# Altium schematic sheet 06_RFID_RTC_Storage.SchDoc: RFID_RTC_Storage
size A4; SheetNumber: 7; SheetTotal: 12
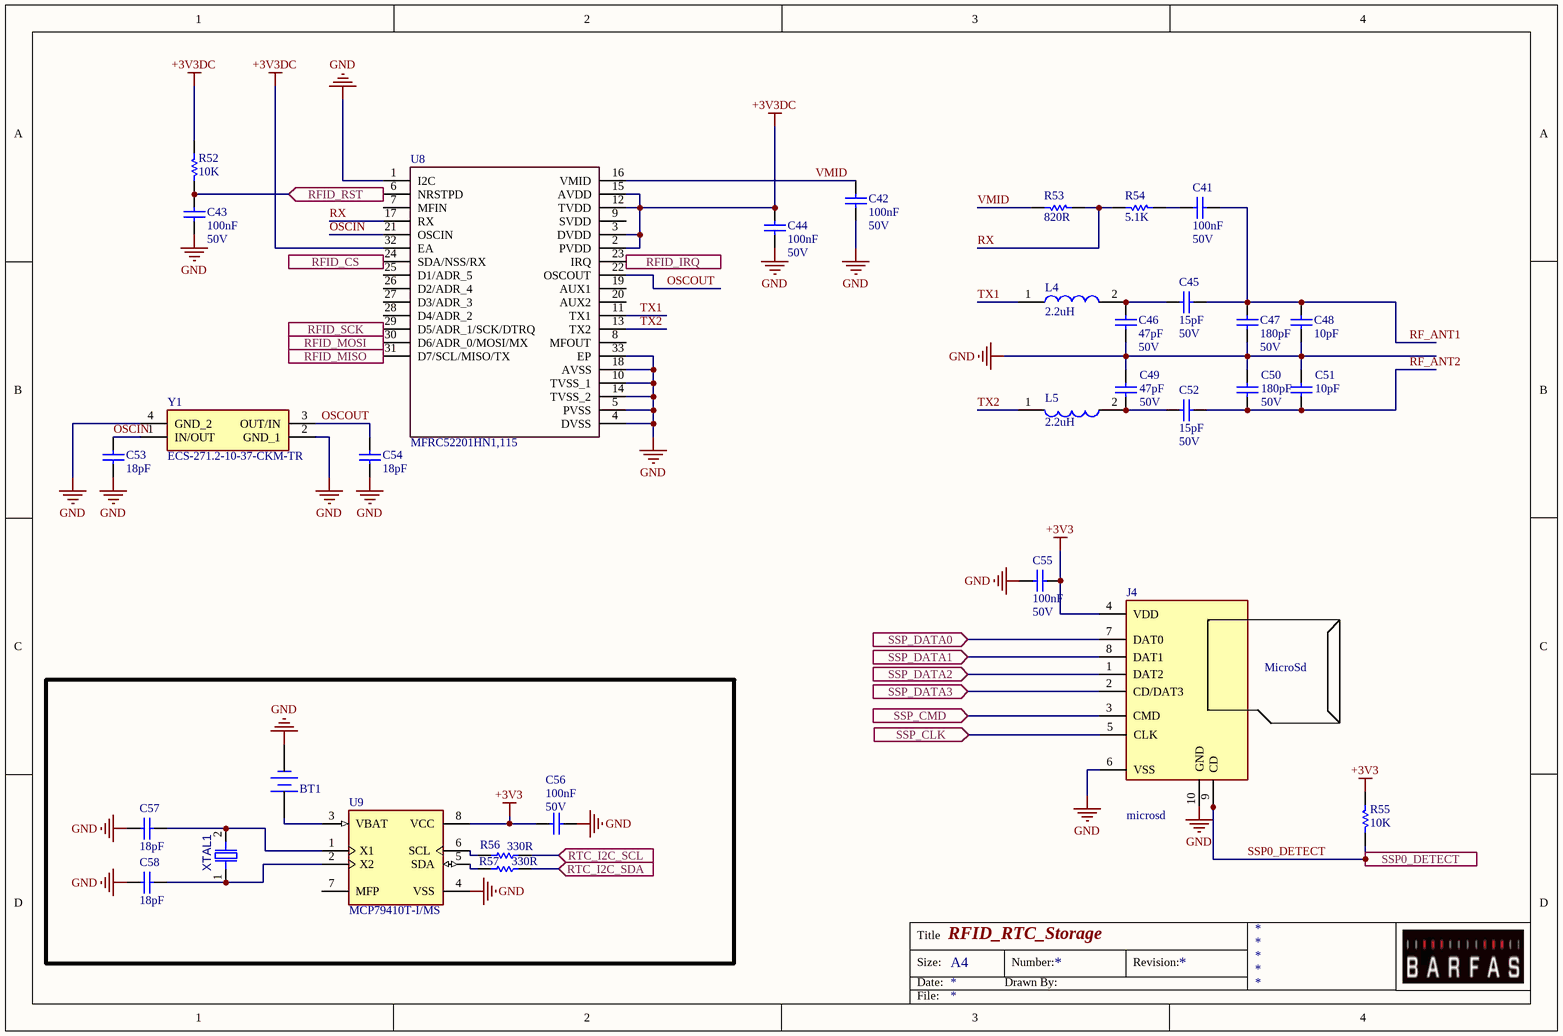
[diagram p0: 06_RFID_RTC_Storage.SchDoc]

## Parts
BT1  DS1092-04-B6P  [DB1092]  (value not drawn)
C41  value 100nF  Voltage: 50V  [CAP_0603]  (hidden comment: CAP)
C42  value 100nF  Voltage: 50V  [CAP_0603]  (hidden comment: CAP)
C43  value 100nF  Voltage: 50V  [CAP_0603]  (hidden comment: CAP)
C44  value 100nF  Voltage: 50V  [CAP_0603]  (hidden comment: CAP)
C45  value 15pF  Voltage: 50V  [CAP_0603]  (hidden comment: CL10C150JB8NNNC)
C46  value 47pF  Voltage: 50V  [CAP_0603]  (hidden comment: CL10C470JB8NNNC)
C47  value 180pF  Voltage: 50V  [CAP_0603]  (hidden comment: CL10C181JB8NNNC)
C48  value 10pF  [CAP_0603]  (hidden comment: CL10C100CB8NNNC)
C49  value 47pF  Voltage: 50V  [CAP_0603]  (hidden comment: CL10C470JB8NNNC)
C50  value 180pF  Voltage: 50V  [CAP_0603]  (hidden comment: CL10C181JB8NNNC)
C51  value 10pF  [CAP_0603]  (hidden comment: CL10C100CB8NNNC)
C52  value 15pF  Voltage: 50V  [CAP_0603]  (hidden comment: CL10C150JB8NNNC)
C53  value 18pF  [CAP_0603]  (hidden comment: CL10C180JB8NNNC)
C54  value 18pF  [CAP_0603]  (hidden comment: CL10C180JB8NNNC)
C55  value 100nF  Voltage: 50V  [CAP_0603]  (hidden comment: CAP)
C56  value 100nF  Voltage: 50V  [CAP_0603]  (hidden comment: CAP)
C57  value 18pF  [CAP_0603]  (hidden comment: CL10C180JB8NNNC)
C58  value 18pF  [CAP_0603]  (hidden comment: CL10C180JB8NNNC)
J4  microsd  [microSD_2]
L4  value 2.2uH  [LQM18PN1R0NC0L]  (hidden comment: LQM18PN2R2NC0L)
L5  value 2.2uH  [LQM18PN1R0NC0L]  (hidden comment: LQM18PN2R2NC0L)
R52  value 10K  [RES_0603]  (hidden comment: RES)
R53  value 820R  [RES_0603]  (hidden comment: 0603SAJ0821T5E)
R54  value 5.1K  [RES_0603]  (hidden comment: RC0603FR-075K1L)
R55  value 10K  [RES_0603]  (hidden comment: RES)
R56  value 330R  [RES_0603]  (hidden comment: 0603SAF3300T5E)
R57  value 330R  [RES_0603]  (hidden comment: 0603SAF3300T5E)
U8  MFRC52201HN1,115  [QFN50P500X500X100-33N-D]
U9  MCP79410T-I/MS  [8_MSOP]
XTAL1  R38-32.768-12.5-EXT-5PPM  [R38_THT_2]  (value not drawn)
Y1  ECS-271.2-10-37-CKM-TR  [ECS27121037CKMTR]

## Ports
RFID_CS (in), RFID_IRQ (in), RFID_MISO (in), RFID_MOSI (in), RFID_RST (in), RFID_SCK (in), RTC_I2C_SCL (in), RTC_I2C_SDA (in), SSP0_DETECT (in), SSP_CLK (in), SSP_CMD (in), SSP_DATA0 (in), SSP_DATA1 (in), SSP_DATA2 (in), SSP_DATA3 (in)

## Nets
+3V3: C55.1 C56.2 J4.4(VDD) R55.1 U9.8(VCC)
+3V3DC: C44.2 R52.1 U8.2(PVDD) U8.3(DVDD) U8.12(TVDD) U8.15(AVDD) U8.32(EA)
GND: BT1.1 C42.1 C43.1 C44.1 C46.2 C47.2 C48.1 C49.1 C50.1 C51.2 C53.1 C54.1 C55.2 C56.1 C57.1 C58.1 J4.6(VSS) J4.10(GND) U8.1(I2C) U8.4(DVSS) U8.5(PVSS) U8.10(TVSS_1) U8.14(TVSS_2) U8.18(AVSS) U8.33(EP) U9.4(VSS) Y1.2(GND_1) Y1.4(GND_2)
OSCIN: C53.2 U8.21(OSCIN) Y1.1(IN/OUT)
OSCOUT: C54.2 U8.22(OSCOUT) Y1.3(OUT/IN)
RF_ANT1: C41.1 C45.1 C47.1 C48.2
RF_ANT2: C50.2 C51.1 C52.1
RFID_CS: U8.24(SDA/NSS/RX) ; port RFID_CS
RFID_IRQ: U8.23(IRQ) ; port RFID_IRQ
RFID_MISO: U8.31(D7/SCL/MISO/TX) ; port RFID_MISO
RFID_MOSI: U8.30(D6/ADR_0/MOSI/MX) ; port RFID_MOSI
RFID_RST: C43.2 R52.2 U8.6(NRSTPD) ; port RFID_RST
RFID_SCK: U8.29(D5/ADR_1/SCK/DTRQ) ; port RFID_SCK
RTC_I2C_SCL: R56.2 ; port RTC_I2C_SCL
RTC_I2C_SDA: R57.2 ; port RTC_I2C_SDA
RX: R53.2 R54.1 U8.17(RX)
SSP0_DETECT: J4.9(CD) R55.2 ; port SSP0_DETECT
SSP_CLK: J4.5(CLK) ; port SSP_CLK
SSP_CMD: J4.3(CMD) ; port SSP_CMD
SSP_DATA0: J4.7(DAT0) ; port SSP_DATA0
SSP_DATA1: J4.8(DAT1) ; port SSP_DATA1
SSP_DATA2: J4.1(DAT2) ; port SSP_DATA2
SSP_DATA3: J4.2(CD/DAT3) ; port SSP_DATA3
TX1: L4.1 U8.11(TX1)
TX2: L5.1 U8.13(TX2)
VMID: C42.2 R53.1 U8.16(VMID)
NetBT1_2: BT1.2 U9.3(VBAT)
NetC41_2: C41.2 R54.2
NetC45_2: C45.2 C46.1 L4.2
NetC49_2: C49.2 C52.2 L5.2
NetC57_2: C57.2 U9.1(X1) XTAL1.2
NetC58_2: C58.2 U9.2(X2) XTAL1.1
NetR56_1: R56.1 U9.6(SCL)
NetR57_1: R57.1 U9.5(SDA)

Not connected (* = marked no-connect by the designer): U8 7(MFIN) 8(MFOUT) 9(SVDD) 19(AUX1) 20(AUX2) 25(D1/ADR_5) 26(D2/ADR_4) 27(D3/ADR_3) 28(D4/ADR_2); U9 7(MFP)

## Notes on the sheet
- Title
- Size:
- Date:
- A4
- Drawn By:
- Number:
- Revision:
- File:
- (in symbol microsd) MicroSd

## Library data of the parts
BT1 = DS1092-04-B6P: BATTERY HOLDER FOR CR2032 HORIZONTAL FEMALE; Manufacturer: CONNFLY; Manufacturer Part Number: DS1092-04-B6P; Supplier 1: Ozdisan
C41-C44 C55 C56 = C01763: CAP CER 100nF 50VDC %10 X7R SMD; Manufacturer: Samsung; Manufacturer Part Number: CL10B104KB8NNNL
C45 C52 = C01763: MLCC (1608) 0603 15pF 50VDC ±5% C0G (NP0); Manufacturer: Samsung; Manufacturer Part Number: CL10C150JB8NNNC
C46 C49 = C01763: MLCC (1608) 0603 47pF 50VDC ±5% C0G (NP0); Manufacturer: Samsung; Manufacturer Part Number: CL10C470JB8NNNC
C47 C50 = C01763: MLCC (1608) 0603 180pF 50VDC ±5% C0G (NP0); Manufacturer: Samsung; Manufacturer Part Number: CL10C181JB8NNNC
C48 C51 = CL10C100CB8NNNC: MLCC (1608) 0603 10pF 50VDC ±0.25pF C0G (NP0); Manufacturer: SAMSUNG; Supplier 1: Ozdisan; Manufacturer Part Number: CL10C100CB8NNNC
C53 C54 C57 C58 = CL10C180JB8NNNC: MLCC (1608) 0603 18pF 50VDC ±5% C0G (NP0); Manufacturer: Samsung Electro-Mechanics America, Inc; Supplier 1: OZDISAN; Manufacturer Part Number: CL10C180JB8NNNC
J4 = microsd: Connector; Part Number: L-KLS1-TF-003-H1.85-R; Unit: USD; Price: 0,26439; Ordering: https://www.ozdisan.com/konnektor-baglanti-elemanlari/sim-sd-kart-konnektorleri/sd-kart-konnektorleri/L-KLS1-TF-003-H1-85-R
L4 L5 = LQM18PN2R2NC0L: FIXED IND 2.2UH 700MA 300 MOHM; Manufacturer: Murata Electronics; Manufacturer Part Number: LQM18PN2R2NC0L
R52 R55 = R02995: RES 0603 10k Ohms %1 1/10W 100PPM; Manufacturer: ROYALOHM; Manufacturer Part Number: 0603SAF1002T5E
R53 = R02995: RES.(1608) 0603 820 Ohms 5% 1/10W-S 100PPM; Manufacturer: ROYALOHM; Manufacturer Part Number: 0603SAJ0821T5E
R54 = R02995: RES 5.1K OHM 1% 1/10W 0603; Manufacturer: YAGEO; Manufacturer Part Number: RC0603FR-075K1L
R56 R57 = 0603SAF3300T5E: RES.(1608) 0603 330 Ohms 1% 1/10W-S 100PPM; Manufacturer: ROYALOHM; Supplier 1: Ozdisan; Manufacturer Part Number: 0603SAF3300T5E
U8 = MFRC52201HN1,115: Integrated Circuit; Manufacturer_Name: NXP; Datasheet Link: https://media.digikey.com/pdf/Data%20Sheets/NXP%20PDFs/MFRC522.pdf; Height: 1mm; Manufacturer_Part_Number: MFRC52201HN1,115; Mouser Part Number: 771-MFRC52201HN1115; Mouser Price/Stock: https://www.mouser.co.uk/ProductDetail/NXP-Semiconductors/MFRC52201HN1115?qs=cbprxTG2Yq8gosQeFVBvCQ%3D%3D; Arrow Part Number: MFRC52201HN1,115; Arrow Price/Stock: https://www.arrow.com/en/products/mfrc52201hn1115/nxp-semiconductors?utm_currency=USD&region=nac
U9 = MCP79410T-I/MS: Real Time Clock (RTC) IC Clock/Calendar 64B, 1Kb I²C, 2-Wire Serial 8-TSSOP, 8-MSOP (0.118", 3.00mm Width); Manufacturer: Microchip Technology; Value: *; Supplier 1: DIGIKEY; Manufacturer Part Number: MCP79410T-I/MS
XTAL1 = R38-32.768-12.5-EXT-5PPM: CRYSTAL 32.768KHZ 12.5pF BULK 5ppm 3X8 EXT; Manufacturer: RALTRON; Manufacturer Part Number: R38-32.768-12.5-EXT-5PPM; Supplier 1: OZDISAN
Y1 = ECS-271.2-10-37-CKM-TR: 27.12 MHz ±10ppm Crystal 10pF 60 Ohms 4-SMD, No Lead; Manufacturer: ECS; Height: 0.55mm; Manufacturer Part Number: ECS-271.2-10-37-CKM-TR